# Altium project Drone_Charge_PCB_Project.PrjPcb
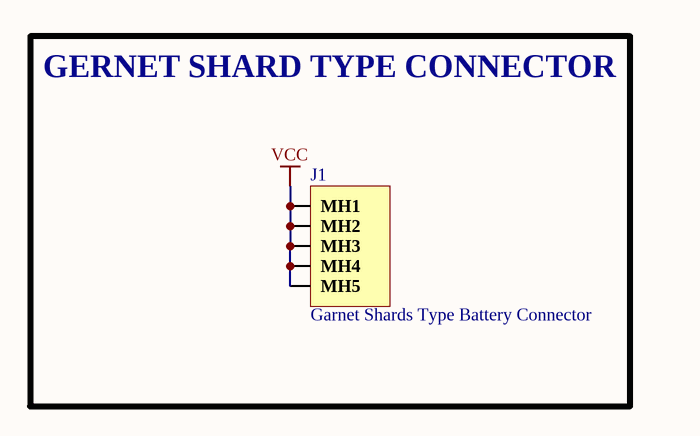
[diagram p0: Drone_Charge_PCB.SchDoc]
1 sheet, 1 parts. Net scope: global (net labels, ports and power ports of the same name join across sheets).
Board file: Drone_Charge_PCB.PcbDoc

## Sheet Drone_Charge_PCB.SchDoc
size A4; SheetNumber: 1; SheetTotal: 1

### Parts
J1  Garnet Shards Type Battery Connector  [Garnet Shards Type Battery Connector]

### Blocks framed on the sheet
GERNET SHARD TYPE CONNECTOR: J1

### Nets
VCC: J1.MH1 J1.MH2 J1.MH3 J1.MH4 J1.MH5

### Notes on the sheet
- File:
- Title:
- Date:
- Page
- Num:
- Total:
- Drawn By: Huzaifa Ali